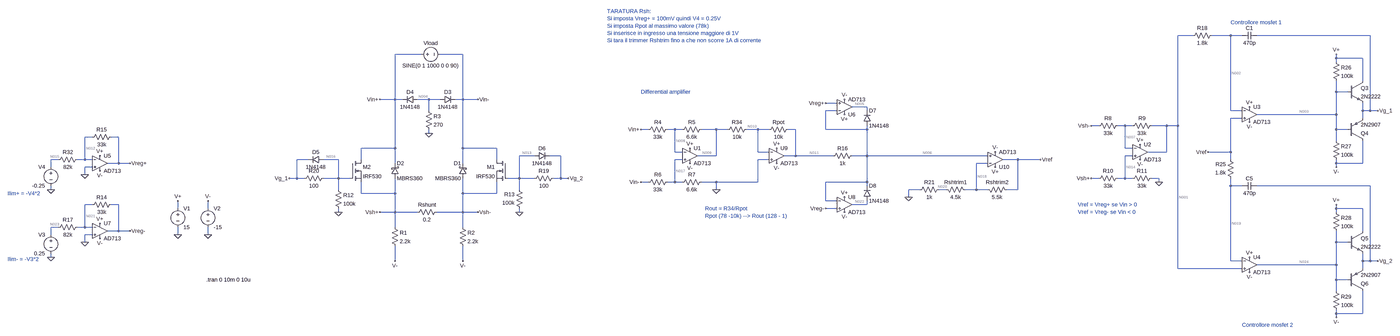
[diagram p0: schematic Electronic load.asc, whole sheet]
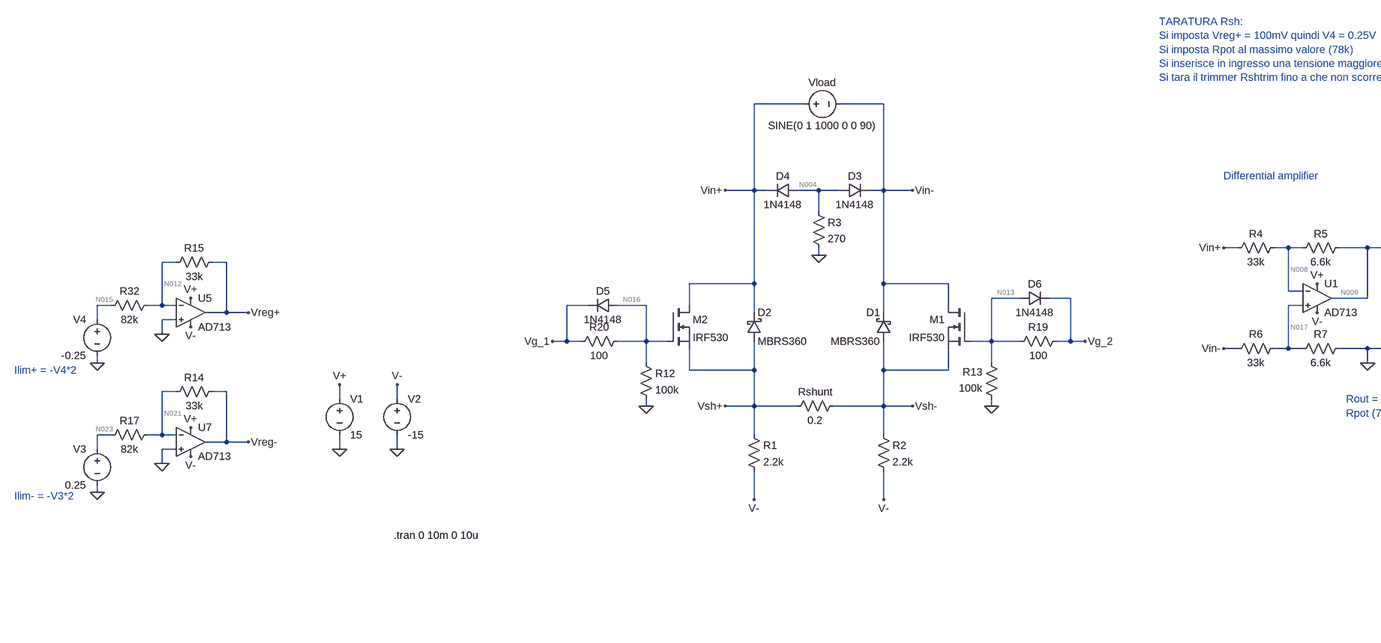
[diagram p1: schematic Electronic load.asc, part, row 1 of 1, column 1 of 2]
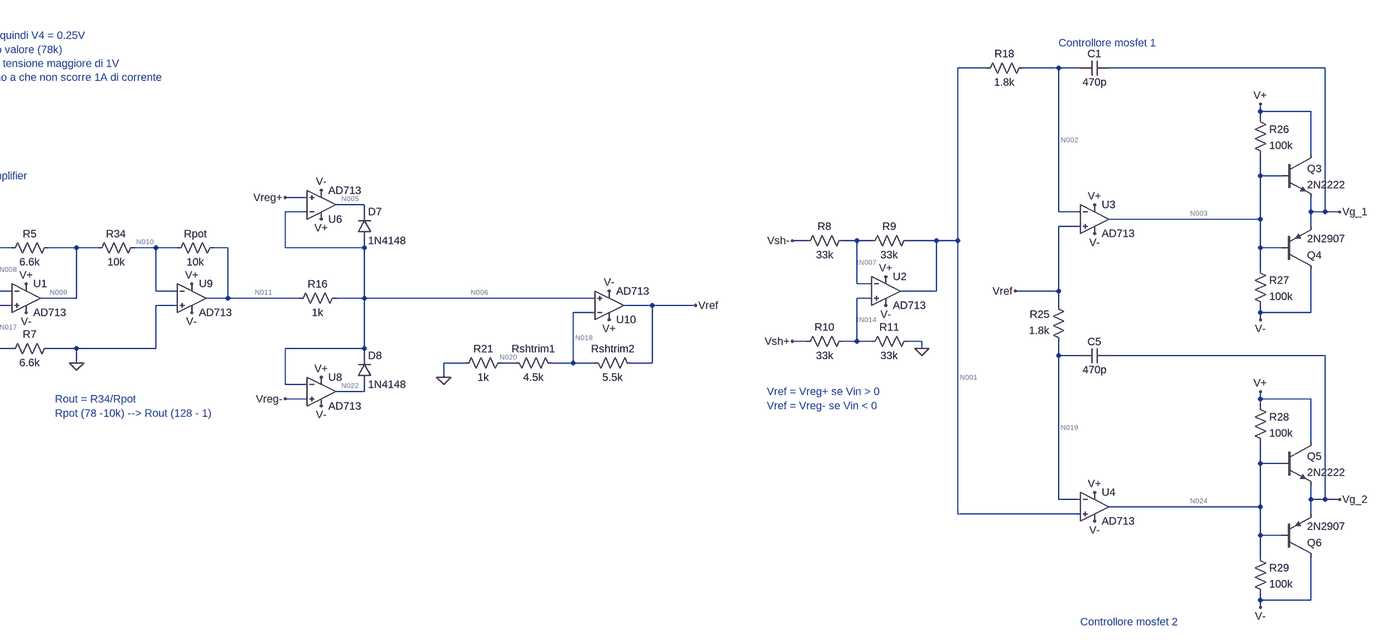
[diagram p2: schematic Electronic load.asc, part, row 1 of 1, column 2 of 2]
Electronic load.asc, the LTspice schematic file:
Version 4
SHEET 1 4616 1272
WIRE 3296 -576 3232 -576
WIRE 3456 -576 3376 -576
WIRE 3504 -576 3456 -576
WIRE 4112 -576 3568 -576
WIRE -144 -496 -256 -496
WIRE 32 -496 -64 -496
WIRE 3968 -480 3968 -496
WIRE 4080 -480 3968 -480
WIRE 3968 -464 3968 -480
WIRE 4080 -384 4080 -480
WIRE 3968 -336 3968 -384
WIRE 4016 -336 3968 -336
WIRE -256 -304 -256 -496
WIRE -256 -304 -320 -304
WIRE -224 -304 -256 -304
WIRE -112 -304 -160 -304
WIRE -64 -304 -112 -304
WIRE 32 -304 32 -496
WIRE 32 -304 0 -304
WIRE 96 -304 32 -304
WIRE 1760 -288 1712 -288
WIRE 1888 -272 1824 -272
WIRE -112 -256 -112 -304
WIRE 1760 -256 1712 -256
WIRE 1888 -256 1888 -272
WIRE 3456 -256 3456 -576
WIRE 3504 -256 3456 -256
WIRE 4080 -256 4080 -288
WIRE 4112 -256 4112 -576
WIRE 4112 -256 4080 -256
WIRE 4144 -256 4112 -256
WIRE 3968 -240 3968 -336
WIRE 3968 -240 3568 -240
WIRE 3504 -224 3456 -224
WIRE 4080 -224 4080 -256
WIRE 2896 -192 2864 -192
WIRE 3008 -192 2976 -192
WIRE 3040 -192 3008 -192
WIRE 3184 -192 3120 -192
WIRE 3232 -192 3232 -576
WIRE 3232 -192 3184 -192
WIRE 960 -176 928 -176
WIRE 1072 -176 1040 -176
WIRE 1104 -176 1072 -176
WIRE 1248 -176 1184 -176
WIRE 1296 -176 1248 -176
WIRE 1424 -176 1376 -176
WIRE 1472 -176 1424 -176
WIRE 1584 -176 1552 -176
WIRE 1712 -176 1712 -256
WIRE 1888 -176 1888 -192
WIRE 1888 -176 1712 -176
WIRE 3968 -176 3968 -240
WIRE 4016 -176 3968 -176
WIRE -112 -160 -112 -176
WIRE -1664 -144 -1696 -144
WIRE -1552 -144 -1584 -144
WIRE 3968 -128 3968 -176
WIRE -256 -96 -256 -304
WIRE -256 -96 -400 -96
WIRE 32 -96 32 -304
WIRE 176 -96 32 -96
WIRE 3008 -96 3008 -192
WIRE 3040 -96 3008 -96
WIRE 1072 -80 1072 -176
WIRE 1104 -80 1072 -80
WIRE 1424 -80 1424 -176
WIRE 1472 -80 1424 -80
WIRE 3184 -80 3184 -192
WIRE 3184 -80 3104 -80
WIRE 3456 -80 3456 -224
WIRE 3456 -80 3360 -80
WIRE 336 -64 272 -64
WIRE 448 -64 400 -64
WIRE 1248 -64 1248 -176
WIRE 1248 -64 1168 -64
WIRE 1584 -64 1584 -176
WIRE 1584 -64 1536 -64
WIRE 1744 -64 1584 -64
WIRE 1888 -64 1888 -176
WIRE 1888 -64 1824 -64
WIRE 2400 -64 1888 -64
WIRE 3040 -64 3008 -64
WIRE -1808 -48 -1840 -48
WIRE -1696 -48 -1696 -144
WIRE -1696 -48 -1728 -48
WIRE -1664 -48 -1696 -48
WIRE -624 -48 -672 -48
WIRE -496 -48 -560 -48
WIRE -400 -48 -400 -96
WIRE 176 -48 176 -96
WIRE 1104 -48 1072 -48
WIRE 1472 -48 1424 -48
WIRE 2528 -48 2464 -48
WIRE 2624 -48 2528 -48
WIRE 3456 -48 3456 -80
WIRE -1552 -32 -1552 -144
WIRE -1552 -32 -1600 -32
WIRE -1504 -32 -1552 -32
WIRE -256 -32 -256 -96
WIRE 32 -32 32 -96
WIRE 2400 -32 2352 -32
WIRE 3968 -32 3968 -48
WIRE 4080 -32 4080 -128
WIRE 4080 -32 3968 -32
WIRE -1840 -16 -1840 -48
WIRE -1664 -16 -1696 -16
WIRE 3968 -16 3968 -32
WIRE -1696 16 -1696 -16
WIRE -672 32 -672 -48
WIRE -672 32 -704 32
WIRE -640 32 -672 32
WIRE -496 32 -496 -48
WIRE -496 32 -560 32
WIRE -448 32 -496 32
WIRE 272 32 272 -64
WIRE 272 32 224 32
WIRE 336 32 272 32
WIRE 448 32 448 -64
WIRE 448 32 416 32
WIRE 480 32 448 32
WIRE 2896 32 2864 32
WIRE 3008 32 3008 -64
WIRE 3008 32 2976 32
WIRE 3040 32 3008 32
WIRE 3152 32 3120 32
WIRE 960 48 928 48
WIRE 1072 48 1072 -48
WIRE 1072 48 1040 48
WIRE 1104 48 1072 48
WIRE 1248 48 1184 48
WIRE 1424 48 1424 -48
WIRE 1424 48 1248 48
WIRE 1888 48 1888 -64
WIRE 1888 48 1712 48
WIRE 3152 48 3152 32
WIRE 1888 64 1888 48
WIRE 3456 64 3456 32
WIRE 3504 64 3456 64
WIRE 4112 64 3568 64
WIRE -1840 80 -1840 64
WIRE -496 80 -496 32
WIRE 272 80 272 32
WIRE 1248 80 1248 48
WIRE 2112 80 2064 80
WIRE 2224 80 2192 80
WIRE 2352 80 2352 -32
WIRE 2352 80 2304 80
WIRE 2400 80 2352 80
WIRE 2528 80 2528 -48
WIRE 2528 80 2480 80
WIRE -400 96 -400 48
WIRE -256 96 -256 32
WIRE -256 96 -400 96
WIRE 32 96 32 32
WIRE 176 96 176 48
WIRE 176 96 32 96
WIRE 2064 112 2064 80
WIRE 1712 128 1712 48
WIRE 1760 128 1712 128
WIRE -1664 144 -1696 144
WIRE -1552 144 -1584 144
WIRE 1888 144 1888 128
WIRE 1888 144 1824 144
WIRE -1216 160 -1216 128
WIRE -1088 160 -1088 128
WIRE 1760 160 1712 160
WIRE 3968 160 3968 144
WIRE 4080 160 3968 160
WIRE -496 176 -496 160
WIRE -256 176 -256 96
WIRE -256 176 -320 176
WIRE -160 176 -256 176
WIRE 32 176 32 96
WIRE 32 176 -80 176
WIRE 96 176 32 176
WIRE 272 176 272 160
WIRE 3968 176 3968 160
WIRE -1808 240 -1840 240
WIRE -1696 240 -1696 144
WIRE -1696 240 -1728 240
WIRE -1664 240 -1696 240
WIRE -256 240 -256 176
WIRE 32 240 32 176
WIRE -1552 256 -1552 144
WIRE -1552 256 -1600 256
WIRE -1504 256 -1552 256
WIRE 4080 256 4080 160
WIRE -1840 272 -1840 240
WIRE -1664 272 -1696 272
WIRE -1216 272 -1216 240
WIRE -1088 272 -1088 240
WIRE -1696 304 -1696 272
WIRE 3968 304 3968 256
WIRE 4016 304 3968 304
WIRE -1840 368 -1840 352
WIRE -256 384 -256 320
WIRE 32 384 32 320
WIRE 3456 384 3456 64
WIRE 3504 384 3456 384
WIRE 4080 384 4080 352
WIRE 4112 384 4112 64
WIRE 4112 384 4080 384
WIRE 4144 384 4112 384
WIRE 3968 400 3968 304
WIRE 3968 400 3568 400
WIRE 3232 416 3232 -192
WIRE 3504 416 3232 416
WIRE 4080 416 4080 384
WIRE 3968 464 3968 400
WIRE 4016 464 3968 464
WIRE 3968 512 3968 464
WIRE 3968 608 3968 592
WIRE 4080 608 4080 512
WIRE 4080 608 3968 608
WIRE 3968 624 3968 608
FLAG -1088 272 0
FLAG -1216 272 0
FLAG -1216 128 V+
FLAG -1088 128 V-
FLAG -256 384 V-
FLAG 32 384 V-
FLAG -112 -160 0
FLAG 1136 -32 V-
FLAG 1136 -96 V+
FLAG 1248 80 0
FLAG 3072 -48 V-
FLAG 3072 -112 V+
FLAG 3152 48 0
FLAG -320 -304 Vin+
FLAG 96 -304 Vin-
FLAG -320 176 Vsh+
FLAG 96 176 Vsh-
FLAG 928 48 Vin-
FLAG 928 -176 Vin+
FLAG 2864 32 Vsh+
FLAG 2864 -192 Vsh-
FLAG 480 32 Vg_2
FLAG 3536 -208 V-
FLAG 3536 -272 V+
FLAG 4144 -256 Vg_1
FLAG -704 32 Vg_1
FLAG 1792 -304 V-
FLAG 1792 -240 V+
FLAG 2624 -48 Vref
FLAG 3360 -80 Vref
FLAG -496 176 0
FLAG 272 176 0
FLAG 3968 -496 V+
FLAG 3968 -16 V-
FLAG 3536 432 V-
FLAG 3536 368 V+
FLAG 3968 144 V+
FLAG 3968 624 V-
FLAG 4144 384 Vg_2
FLAG -1632 0 V-
FLAG -1632 -64 V+
FLAG -1504 -32 Vreg+
FLAG -1840 80 0
FLAG 1792 176 V-
FLAG 1792 112 V+
FLAG 1712 -288 Vreg+
FLAG 1712 160 Vreg-
FLAG -1696 16 0
FLAG -1632 288 V-
FLAG -1632 224 V+
FLAG -1504 256 Vreg-
FLAG -1840 368 0
FLAG -1696 304 0
FLAG 1504 -32 V-
FLAG 1504 -96 V+
FLAG 2432 -80 V-
FLAG 2432 -16 V+
FLAG 2064 112 0
SYMBOL voltage -1216 144 R0
SYMATTR InstName V1
SYMATTR Value 15
SYMBOL voltage -1088 144 R0
SYMATTR InstName V2
SYMATTR Value -15
SYMBOL nmos 224 -48 M0
SYMATTR InstName M1
SYMATTR Value IRF530
SYMBOL nmos -448 -48 R0
SYMATTR InstName M2
SYMATTR Value IRF530
SYMBOL schottky -272 32 M180
WINDOW 0 24 64 Left 2
WINDOW 3 24 0 Left 2
SYMATTR InstName D2
SYMATTR Value MBRS360
SYMATTR Description Diode
SYMATTR Type diode
SYMBOL res -176 192 R270
WINDOW 0 32 56 VTop 2
WINDOW 3 0 56 VBottom 2
SYMATTR InstName Rshunt
SYMATTR Value 0.2
SYMBOL res -272 224 R0
SYMATTR InstName R1
SYMATTR Value 2.2k
SYMBOL res 16 224 R0
SYMATTR InstName R2
SYMATTR Value 2.2k
SYMBOL diode -64 -320 M90
WINDOW 0 0 32 VBottom 2
WINDOW 3 32 32 VTop 2
SYMATTR InstName D3
SYMATTR Value 1N4148
SYMBOL diode -160 -288 M270
WINDOW 0 32 32 VTop 2
WINDOW 3 0 32 VBottom 2
SYMATTR InstName D4
SYMATTR Value 1N4148
SYMBOL res -128 -272 R0
SYMATTR InstName R3
SYMATTR Value 270
SYMBOL schottky 48 32 R180
WINDOW 0 24 64 Left 2
WINDOW 3 24 0 Left 2
SYMATTR InstName D1
SYMATTR Value MBRS360
SYMATTR Description Diode
SYMATTR Type diode
SYMBOL OpAmps\\AD713 1136 -128 R0
SYMATTR InstName U1
SYMBOL res 1056 -192 R90
WINDOW 0 0 56 VBottom 2
WINDOW 3 32 56 VTop 2
SYMATTR InstName R4
SYMATTR Value 33k
SYMBOL res 1200 -192 R90
WINDOW 0 0 56 VBottom 2
WINDOW 3 32 56 VTop 2
SYMATTR InstName R5
SYMATTR Value 6.6k
SYMBOL res 1056 32 R90
WINDOW 0 0 56 VBottom 2
WINDOW 3 32 56 VTop 2
SYMATTR InstName R6
SYMATTR Value 33k
SYMBOL res 1200 32 R90
WINDOW 0 0 56 VBottom 2
WINDOW 3 32 56 VTop 2
SYMATTR InstName R7
SYMATTR Value 6.6k
SYMBOL OpAmps\\AD713 3072 -144 R0
SYMATTR InstName U2
SYMBOL res 2992 -208 R90
WINDOW 0 0 56 VBottom 2
WINDOW 3 32 56 VTop 2
SYMATTR InstName R8
SYMATTR Value 33k
SYMBOL res 3136 -208 R90
WINDOW 0 0 56 VBottom 2
WINDOW 3 32 56 VTop 2
SYMATTR InstName R9
SYMATTR Value 33k
SYMBOL res 2992 16 R90
WINDOW 0 0 56 VBottom 2
WINDOW 3 32 56 VTop 2
SYMATTR InstName R10
SYMATTR Value 33k
SYMBOL res 3136 16 R90
WINDOW 0 0 56 VBottom 2
WINDOW 3 32 56 VTop 2
SYMATTR InstName R11
SYMATTR Value 33k
SYMBOL voltage -160 -496 M90
WINDOW 0 -32 56 VBottom 2
WINDOW 3 32 56 VTop 2
WINDOW 123 0 0 Left 0
WINDOW 39 0 0 Left 0
SYMATTR InstName Vload
SYMATTR Value SINE(0 1 1000 0 0 90)
SYMBOL OpAmps\\AD713 3536 -304 R0
SYMATTR InstName U3
SYMBOL res 432 16 R90
WINDOW 0 0 56 VBottom 2
WINDOW 3 32 56 VTop 2
SYMATTR InstName R19
SYMATTR Value 100
SYMBOL res -656 48 R270
WINDOW 0 32 56 VTop 2
WINDOW 3 0 56 VBottom 2
SYMATTR InstName R20
SYMATTR Value 100
SYMBOL cap 3568 -592 R90
WINDOW 0 0 32 VBottom 2
WINDOW 3 32 32 VTop 2
SYMATTR InstName C1
SYMATTR Value 470p
SYMBOL res 3392 -592 R90
WINDOW 0 0 56 VBottom 2
WINDOW 3 32 56 VTop 2
SYMATTR InstName R18
SYMATTR Value 1.8k
SYMBOL OpAmps\\AD713 1792 -208 M180
SYMATTR InstName U6
SYMBOL res -512 64 R0
SYMATTR InstName R12
SYMATTR Value 100k
SYMBOL res 288 176 R180
WINDOW 0 36 76 Left 2
WINDOW 3 36 40 Left 2
SYMATTR InstName R13
SYMATTR Value 100k
SYMBOL diode -560 -32 M270
WINDOW 0 32 32 VTop 2
WINDOW 3 0 32 VBottom 2
SYMATTR InstName D5
SYMATTR Value 1N4148
SYMBOL diode 336 -80 M90
WINDOW 0 0 32 VBottom 2
WINDOW 3 32 32 VTop 2
SYMATTR InstName D6
SYMATTR Value 1N4148
SYMBOL npn 4016 -384 R0
SYMATTR InstName Q3
SYMATTR Value 2N2222
SYMBOL pnp 4016 -128 M180
SYMATTR InstName Q4
SYMATTR Value 2N2907
SYMBOL res 3952 -480 R0
SYMATTR InstName R26
SYMATTR Value 100k
SYMBOL res 3952 -144 R0
SYMATTR InstName R27
SYMATTR Value 100k
SYMBOL OpAmps\\AD713 3536 336 R0
SYMATTR InstName U4
SYMBOL cap 3568 48 R90
WINDOW 0 0 32 VBottom 2
WINDOW 3 32 32 VTop 2
SYMATTR InstName C5
SYMATTR Value 470p
SYMBOL res 3472 48 R180
WINDOW 0 36 76 Left 2
WINDOW 3 36 40 Left 2
SYMATTR InstName R25
SYMATTR Value 1.8k
SYMBOL npn 4016 256 R0
SYMATTR InstName Q5
SYMATTR Value 2N2222
SYMBOL pnp 4016 512 M180
SYMATTR InstName Q6
SYMATTR Value 2N2907
SYMBOL res 3952 160 R0
SYMATTR InstName R28
SYMATTR Value 100k
SYMBOL res 3952 496 R0
SYMATTR InstName R29
SYMATTR Value 100k
SYMBOL OpAmps\\AD713 -1632 -96 R0
SYMATTR InstName U5
SYMBOL res -1568 -160 R90
WINDOW 0 0 56 VBottom 2
WINDOW 3 32 56 VTop 2
SYMATTR InstName R15
SYMATTR Value 33k
SYMBOL voltage -1840 -32 M0
WINDOW 123 0 0 Left 0
WINDOW 39 0 0 Left 0
SYMATTR InstName V4
SYMATTR Value -0.25
SYMBOL res -1824 -32 R270
WINDOW 0 32 56 VTop 2
WINDOW 3 0 56 VBottom 2
SYMATTR InstName R32
SYMATTR Value 82k
SYMBOL diode 1872 -192 M180
WINDOW 0 24 64 Left 2
WINDOW 3 24 0 Left 2
SYMATTR InstName D7
SYMATTR Value 1N4148
SYMBOL OpAmps\\AD713 1792 80 R0
SYMATTR InstName U8
SYMBOL diode 1872 128 M180
WINDOW 0 24 64 Left 2
WINDOW 3 24 0 Left 2
SYMATTR InstName D8
SYMATTR Value 1N4148
SYMBOL res 1392 -192 R90
WINDOW 0 0 56 VBottom 2
WINDOW 3 32 56 VTop 2
SYMATTR InstName R34
SYMATTR Value 10k
SYMBOL res 1568 -192 R90
WINDOW 0 0 56 VBottom 2
WINDOW 3 32 56 VTop 2
SYMATTR InstName Rpot
SYMATTR Value 10k
SYMBOL OpAmps\\AD713 -1632 192 R0
SYMATTR InstName U7
SYMBOL res -1568 128 R90
WINDOW 0 0 56 VBottom 2
WINDOW 3 32 56 VTop 2
SYMATTR InstName R14
SYMATTR Value 33k
SYMBOL voltage -1840 256 M0
WINDOW 123 0 0 Left 0
WINDOW 39 0 0 Left 0
SYMATTR InstName V3
SYMATTR Value 0.25
SYMBOL res -1824 256 R270
WINDOW 0 32 56 VTop 2
WINDOW 3 0 56 VBottom 2
SYMATTR InstName R17
SYMATTR Value 82k
SYMBOL OpAmps\\AD713 1504 -128 R0
SYMATTR InstName U9
SYMBOL OpAmps\\AD713 2432 16 M180
SYMATTR InstName U10
SYMBOL res 1840 -80 R90
WINDOW 0 0 56 VBottom 2
WINDOW 3 32 56 VTop 2
SYMATTR InstName R16
SYMATTR Value 1k
SYMBOL res 2496 96 M270
WINDOW 0 32 56 VTop 2
WINDOW 3 0 56 VBottom 2
SYMATTR InstName Rshtrim2
SYMATTR Value 5.5k
SYMBOL res 2320 96 M270
WINDOW 0 32 56 VTop 2
WINDOW 3 0 56 VBottom 2
SYMATTR InstName Rshtrim1
SYMATTR Value 4.5k
SYMBOL res 2208 64 R90
WINDOW 0 0 56 VBottom 2
WINDOW 3 32 56 VTop 2
SYMATTR InstName R21
SYMATTR Value 1k
TEXT -1096 464 Left 2 !.tran 0 10m 0 10u
TEXT 2808 144 Left 2 ;Vref = Vreg+ se Vin > 0\nVref = Vreg- se Vin < 0
TEXT 928 -336 Left 2 ;Differential amplifier
TEXT 3456 -632 Left 2 ;Controllore mosfet 1
TEXT 3504 656 Left 2 ;Controllore mosfet 2
TEXT 1200 192 Left 2 ;Rpot (78 -10k) --> Rout (128 - 1)
TEXT 1200 160 Left 2 ;Rout = R34/Rpot
TEXT -2024 96 Left 2 ;Ilim+ = -V4*2
TEXT -2024 376 Left 2 ;Ilim- = -V3*2
TEXT 784 -680 Left 2 ;TARATURA Rsh:\nSi imposta Vreg+ = 100mV quindi V4 = 0.25V\nSi imposta Rpot al massimo valore (78k)\nSi inserisce in ingresso una tensione maggiore di 1V\nSi tara il trimmer Rshtrim fino a che non scorre 1A di corrente

The netlist it stands for:
* Electronic load.asc
V1 V+ 0 15
V2 V- 0 -15
M1 Vin- N013 Vsh- Vsh- IRF530
M2 Vin+ N016 Vsh+ Vsh+ IRF530
D2 Vsh+ Vin+ MBRS360
Rshunt Vsh+ Vsh- 0.2
R1 Vsh+ V- 2.2k
R2 Vsh- V- 2.2k
D3 N004 Vin- 1N4148
D4 N004 Vin+ 1N4148
R3 N004 0 270
D1 Vsh- Vin- MBRS360
XU1 N017 N008 V+ V- N009 AD712  ; AD713, pins In+ In- V+ V- OUT
R4 N008 Vin+ 33k
R5 N009 N008 6.6k
R6 N017 Vin- 33k
R7 0 N017 6.6k
XU2 N014 N007 V+ V- N001 AD712  ; AD713, pins In+ In- V+ V- OUT
R8 N007 Vsh- 33k
R9 N001 N007 33k
R10 N014 Vsh+ 33k
R11 0 N014 33k
Vload Vin+ Vin- SINE(0 1 1000 0 0 90)
XU3 Vref N002 V+ V- N003 AD712  ; AD713, pins In+ In- V+ V- OUT
R19 Vg_2 N013 100
R20 Vg_1 N016 100
C1 Vg_1 N002 470p
R18 N002 N001 1.8k
XU6 Vreg+ N006 V+ V- N005 AD712  ; AD713, pins In+ In- V+ V- OUT
R12 N016 0 100k
R13 0 N013 100k
D5 N016 Vg_1 1N4148
D6 N013 Vg_2 1N4148
Q3 V+ N003 Vg_1 0 2N2222
Q4 V- N003 Vg_1 0 2N2907
R26 V+ N003 100k
R27 N003 V- 100k
XU4 N001 N019 V+ V- N024 AD712  ; AD713, pins In+ In- V+ V- OUT
C5 Vg_2 N019 470p
R25 N019 Vref 1.8k
Q5 V+ N024 Vg_2 0 2N2222
Q6 V- N024 Vg_2 0 2N2907
R28 V+ N024 100k
R29 N024 V- 100k
XU5 0 N012 V+ V- Vreg+ AD712  ; AD713, pins In+ In- V+ V- OUT
R15 Vreg+ N012 33k
V4 N015 0 -0.25
R32 N015 N012 82k
D7 N006 N005 1N4148
XU8 Vreg- N006 V+ V- N022 AD712  ; AD713, pins In+ In- V+ V- OUT
D8 N022 N006 1N4148
R34 N010 N009 10k
Rpot N011 N010 10k
XU7 0 N021 V+ V- Vreg- AD712  ; AD713, pins In+ In- V+ V- OUT
R14 Vreg- N021 33k
V3 N023 0 0.25
R17 N023 N021 82k
XU9 0 N010 V+ V- N011 AD712  ; AD713, pins In+ In- V+ V- OUT
XU10 N006 N018 V+ V- Vref AD712  ; AD713, pins In+ In- V+ V- OUT
R16 N006 N011 1k
Rshtrim2 Vref N018 5.5k
Rshtrim1 N018 N020 4.5k
R21 N020 0 1k
.model D D
.lib standard.dio
.model NPN NPN
.model PNP PNP
.lib standard.bjt
.model NMOS NMOS
.model PMOS PMOS
.lib standard.mos
.tran 0 10m 0 10u
* Vref = Vreg+ se Vin > 0
* Vref = Vreg- se Vin < 0
* Differential amplifier
* Controllore mosfet 1
* Controllore mosfet 2
* Rpot (78 -10k) --> Rout (128 - 1)
* Rout = R34/Rpot
* Ilim+ = -V4*2
* Ilim- = -V3*2
* TARATURA Rsh:
* Si imposta Vreg+ = 100mV quindi V4 = 0.25V
* Si imposta Rpot al massimo valore (78k)
* Si inserisce in ingresso una tensione maggiore di 1V
* Si tara il trimmer Rshtrim fino a che non scorre 1A di corrente
.lib ADI1.lib
.backanno
.end

* Results of the author's LTspice run, read from the files saved beside the schematic
* Operating Point, zero values left out:
*   V(v+) = 15 V
*   V(v-) = -15 V
*   V(vin-) = -3.55 V
*   V(n013) = -1.665 V
*   V(vsh-) = -3.206 V
*   V(vin+) = -2.55 V
*   V(n016) = 1.718 V
*   V(vsh+) = -3.004 V
*   V(n004) = -2.853 V
*   V(n008) = -591.7 mV
*   V(n017) = -591.7 mV
*   V(n009) = -200 mV
*   V(n007) = -1.502 V
*   V(n014) = -1.502 V
*   V(n001) = 201.2 mV
*   V(n002) = 201.2 mV
*   V(vref) = 201.2 mV
*   V(n003) = 2.267 V
*   V(vg_2) = -1.667 V
*   V(vg_1) = 1.72 V
*   V(n006) = 100.6 mV
*   V(vreg+) = 100.6 mV
*   V(n005) = -379 mV
*   V(n019) = 201.2 mV
*   V(n024) = -2.214 V
*   V(n012) = -174 nV
*   V(n015) = -250 mV
*   V(vreg-) = -100.6 mV
*   V(n022) = -14.06 V
*   V(n010) = -429.4 nV
*   V(n011) = 200 mV
*   V(n021) = 174 nV
*   V(n023) = 250 mV
*   V(n018) = 100.6 mV
*   V(n020) = 18.29 mV
*   Ic(Q3) = 17.11 µA
*   Ib(Q3) = 75.87 nA
*   Ie(Q3) = -17.18 µA
*   Ic(Q5) = 17.22 pA
*   Ib(Q5) = -17.76 pA
*   Ic(Q4) = -17.27 pA
*   Ib(Q4) = 17.82 pA
*   Ic(Q6) = -16.59 µA
*   Ib(Q6) = -59.97 nA
*   Ie(Q6) = 16.65 µA
*   Id(M1) = -31.97 µA
*   Is(M1) = 31.97 µA
*   Id(M2) = 1.011 A
*   Is(M2) = -1.011 A
*   I(D2) = -22.6 µA
*   I(D1) = 1.001 A
*   I(D3) = 10.57 mA
*   I(D4) = -2.517 nA
*   I(D5) = -93.77 pA
*   I(D6) = 94.33 pA
*   I(D7) = 99.39 µA
*   I(D8) = -2.534 nA
*   I(Rshunt) = 1.006 A
*   I(R1) = 5.453 mA
*   I(R2) = 5.361 mA
*   I(R3) = -10.57 mA
*   I(R4) = 59.35 µA
*   I(R5) = 59.35 µA
*   I(R6) = 89.65 µA
*   I(R7) = 89.65 µA
*   I(R8) = 51.62 µA
*   I(R9) = 51.62 µA
*   I(R10) = 45.52 µA
*   I(R11) = 45.52 µA
*   I(R19) = -16.65 µA
*   I(R20) = 17.18 µA
*   I(R18) = -25.54 pA
*   I(R12) = 17.18 µA
*   I(R13) = 16.65 µA
*   I(R26) = 127.3 µA
*   I(R27) = 172.7 µA
*   I(R25) = -25.54 pA
*   I(R28) = 172.1 µA
*   I(R29) = 127.9 µA
*   I(R15) = 3.049 µA
*   I(R32) = -3.049 µA
*   I(R34) = 20 µA
*   I(Rpot) = 20 µA
*   I(R14) = -3.049 µA
*   I(R17) = 3.049 µA
*   I(R16) = -99.39 µA
*   I(Rshtrim2) = 18.29 µA
*   I(Rshtrim1) = 18.29 µA
*   I(R21) = 18.29 µA
*   I(V1) = -49.38 mA
*   I(V2) = 60.04 mA
*   I(Vload) = -1.011 A
*   I(V4) = 3.049 µA
*   I(V3) = -3.049 µA
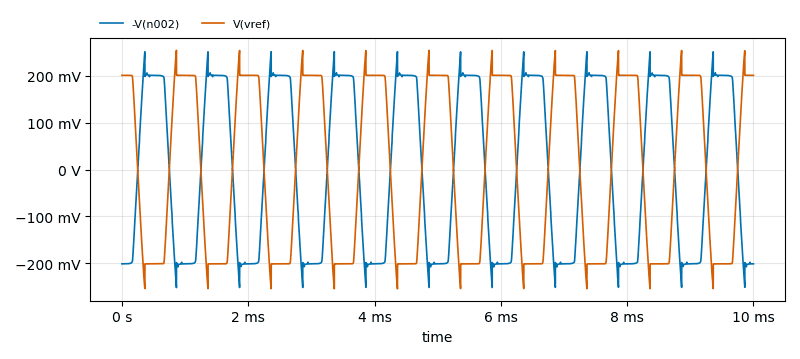
[diagram p3: Transient Analysis of Electronic load.asc, plotted from the saved traces]
* Transient Analysis, 1 run:
*   -V(n002): min -251.9 mV, max 251.8 mV, average -2.653 µV, rms 178.7 mV, last -201.2 mV
*   V(vref): min -254.5 mV, max 254.5 mV, average -840.6 nV, rms 180 mV, last 201.2 mV